# Altium schematic sheet RVM_EF_Sheet1.SchDoc
size A4; SheetNumber: 2; SheetTotal: 6
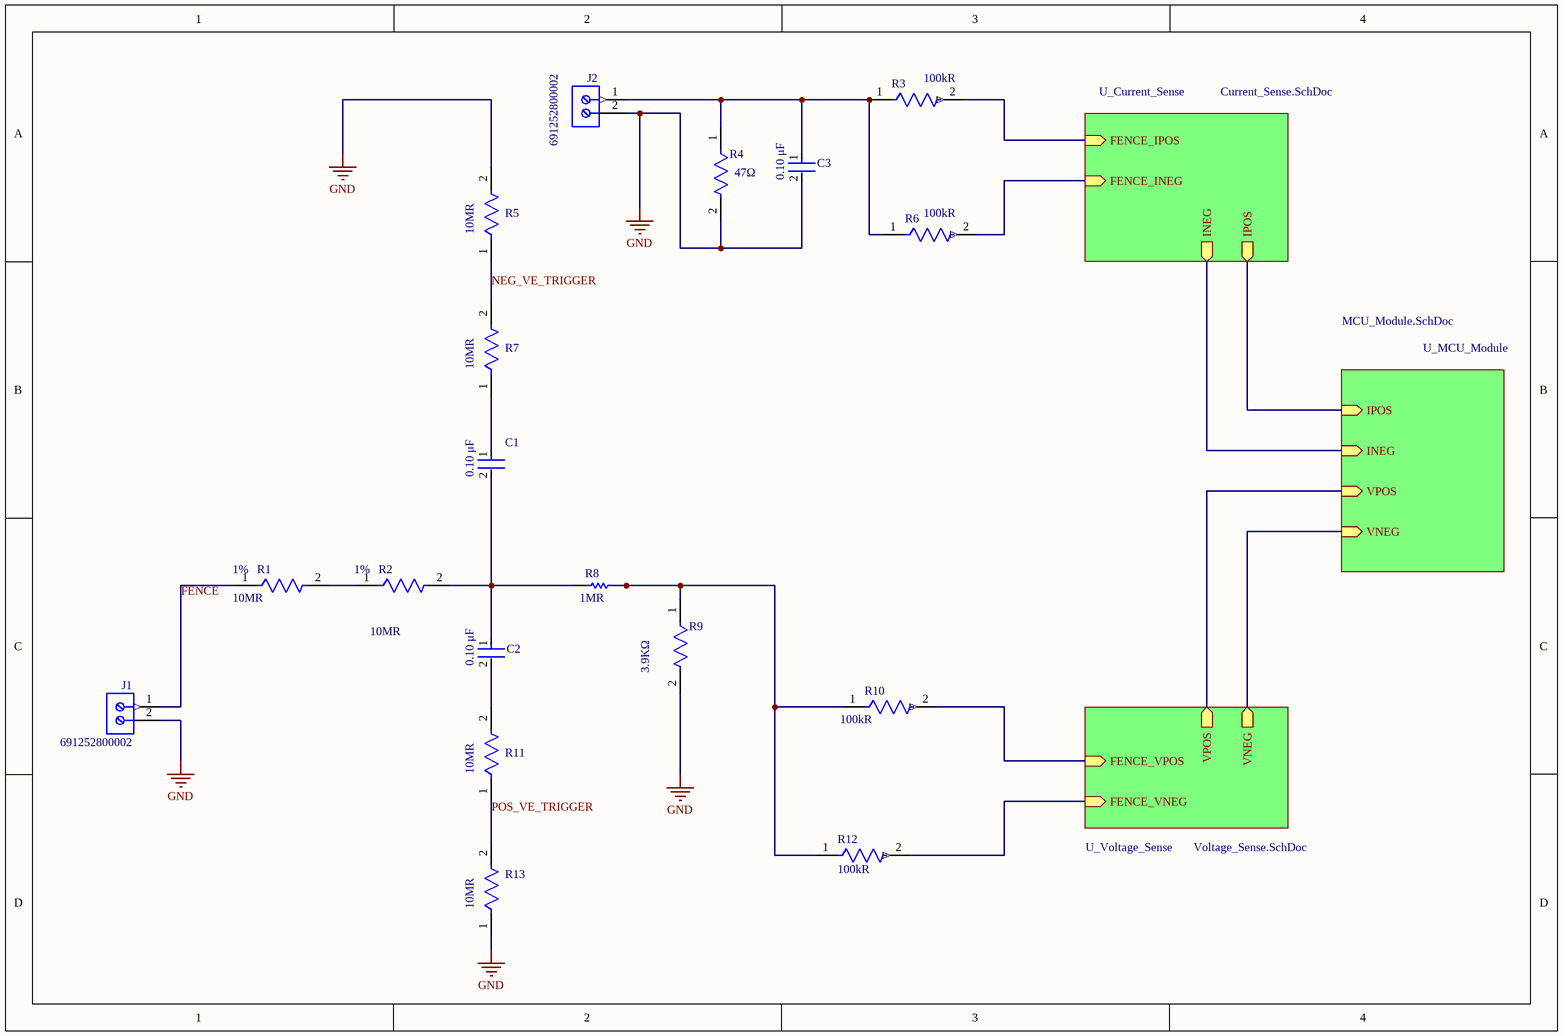
[diagram p0: RVM_EF_Sheet1.SchDoc]

## Parts
C1  value 0.10 μF  [FP-C1206C-EB-MFG]  (hidden comment: C1206C104F3GACTU)
C2  value 0.10 μF  [FP-C1206C-EB-MFG]  (hidden comment: C1206C104F3GACTU)
C3  value 0.10 μF  [FP-C1206C-EB-MFG]  (hidden comment: C1206C104F3GACTU)
J1  691252800002  [691252800002]
J2  691252800002  [691252800002]
R1  Tolerance: 1%  Resistance: 10MR  [FP-CRCW2512-e3-IPC_A]  (hidden comment: CRCW251210M0FKEH)
R2  Tolerance: 1%  Resistance: 10MR  [FP-CRCW2512-e3-IPC_A]  (hidden comment: CRCW251210M0FKEH)
R3  Resistance: 100kR  [FP-MCU0805-IPC_B]  (hidden comment: MCU08050D1003BP500)
R4  Resistance: 47Ω  [FP-RT1206-MFG]  (hidden comment: RT1206FRE0747RL)
R5  Resistance: 10MR  [FP-CRCW0805-e3-MFG]  (hidden comment: CRCW080510M0FKEC)
R6  Resistance: 100kR  [FP-MCU0805-IPC_B]  (hidden comment: MCU08050D1003BP500)
R7  Resistance: 10MR  [FP-CRCW0805-e3-MFG]  (hidden comment: CRCW080510M0FKEC)
R8  value 1MR  [RESC0805(2012)_N]  (hidden comment: 1M 1% 0805(2012))
R9  value 3.9KΩ  [FP-RT0805-MFG]  (hidden comment: RT0805DRD073K9L)
R10  Resistance: 100kR  [FP-MCU0805-IPC_B]  (hidden comment: MCU08050D1003BP500)
R11  Resistance: 10MR  [FP-CRCW0805-e3-MFG]  (hidden comment: CRCW080510M0FKEC)
R12  Resistance: 100kR  [FP-MCU0805-IPC_B]  (hidden comment: MCU08050D1003BP500)
R13  Resistance: 10MR  [FP-CRCW0805-e3-MFG]  (hidden comment: CRCW080510M0FKEC)

## Sub-sheets
U_Current_Sense = Current_Sense.SchDoc: FENCE_IPOS (in), FENCE_INEG (in), IPOS (out), INEG (out)
U_MCU_Module = MCU_Module.SchDoc: IPOS (in), INEG (in), VPOS (in), VNEG (in)
U_Voltage_Sense = Voltage_Sense.SchDoc: FENCE_VPOS (in), FENCE_VNEG (in), VPOS (out), VNEG (out)

## Nets
GND: C3.2 J1.2 J2.2 R4.2 R5.2 R9.2 R13.1
FENCE: J1.1 R1.1
NEG_VE_TRIGGER: R5.1 R7.2
POS_VE_TRIGGER: R11.1 R13.2
NetC1_1: C1.1 R7.1
NetC1_2: C1.2 C2.1 R2.2 R8.1
NetC2_2: C2.2 R11.2
NetC3_1: C3.1 J2.1 R3.1 R4.1 R6.1
NetR1_2: R1.2 R2.1
NetR3_2: R3.2 ; sheet U_Current_Sense/FENCE_IPOS
NetR6_2: R6.2 ; sheet U_Current_Sense/FENCE_INEG
NetR8_2: R8.2 R9.1 R10.1 R12.1
NetR10_2: R10.2 ; sheet U_Voltage_Sense/FENCE_VPOS
NetR12_2: R12.2 ; sheet U_Voltage_Sense/FENCE_VNEG
(unnamed): sheet U_Voltage_Sense/VPOS, sheet U_MCU_Module/VPOS
(unnamed): sheet U_Voltage_Sense/VNEG, sheet U_MCU_Module/VNEG
(unnamed): sheet U_Current_Sense/IPOS, sheet U_MCU_Module/IPOS
(unnamed): sheet U_Current_Sense/INEG, sheet U_MCU_Module/INEG

## Library data of the parts
C1-C3 = CMP-1037-04186-2: CAP CER 0.1UF 25V C0G/NP0 1206; Manufacturer: KEMET; Material: Ceramic; Temperature Characteristic: C0G; Temperature Coefficient: 15%; Tolerance: 0.01; Automotive Grade: Grade 0; Device Class L3: Ceramic Capacitors; Voltage Rating: 25 V; Temperature Range Low: -55°C; RoHS: TRUE; Package: C1206C-EB; Category: Cap; Lead Free: Yes; Manufacturer Part Number: C1206C104F3GACTU; ComponentLink2URL: https://content.kemet.com/datasheets/KEM_C1007_X8R_ULTRA_150C_SMD.pdf; Ipc Land Pattern Name: CAPC320160X78; Temperature Range High: +150°C; Height: 0.88mm; Digikey Description: CAP CER 0.1UF 25V C0G/NP0 1206; ComponentLink2Description: Datasheet; Capacitance: 0.10 μF; Mouser Description: Multilayer Ceramic Capacitors MLCC - SMD/SMT 25volts 0.1uF 1% C0G; Octopart: https://octopart.com/c1206c104f3gactu-kemet-13149870; Device Class L1: Passive Components; Device Class L2: Capacitors; Automotive: Yes; Temperature: -55°C to +150°C
J1 J2 = CMP-1502-02796-3: Terminal Block, 10MM Pitch, Vertical, Rising Cage Clamp, 12-30 AWG, 2 Pin
R1 R2 = CMP-1018-00962-2: RES Thick Film, 10MΩ, 1%, 1W, 100ppm/°C, 2512; Height: 0.028inch; Min Operating Temperature: -55°C; Number of Terminations: 2; Lead Free: Lead Free; Composition: Thick Film; Packaging: Tape and Reel; Case/Package: 2512; Length: 0.248inch; Max Power Dissipation: 1W; Temperature Coefficient: 100ppm/°C; Max Operating Temperature: 155°C; Features: Automotive AEC-Q200; Width: 0.124inch
R3 R6 R10 R12 = CMP-02407-000489-1: RES 1.05K OHM 0.5% 1/5W 0805; Tolerance: 0.1%; Voltage Rating: 150V; Temperature Coefficient: 25ppm/°C; Power Rating: 125mW; REACH SVHC: No SVHC; Radiation Hardening: No; Composition: Thin Film; Contact Plating: Tin; Lead Free: Lead Free; Max Operating Temperature: 125°C; Width: 1.25mm; Case/Package: 0805; Depth: 1.25mm; Packaging: Tape and Reel; Case Code (Imperial): 0805; Length: 2mm; Case Code (Metric): 2012; Min Operating Temperature: -55°C; Voltage Rating (DC): 150V; Military Standard: Not
R4 = CMP-2003-04115-2: RES SMD 47 OHM 1% 1/4W 1206; Manufacturer: Yageo; Voltage Rating: 200V; Value: 47Ω; Temperature Coefficient: 50 ppm/°C; Tolerance: 0.0002; Power Rating: 0.25W; Temperature Range High: +155°C; Category: Res; Temperature Range Low: -55°C; Device Class L3: Chip SMD Resistors; Temperature: -55°C to +155°C; RoHS: TRUE; Composition: Thin Film; Digikey Description: RES SMD 47 OHM 1% 1/4W 1206; Lead Free: Yes; Series: RT; Automotive: No; ComponentLink2Description: Datasheet; Device Class L2: Resistors; Ipc Land Pattern Name: RESC310160X55; ComponentLink2URL: http://www.yageo.com/documents/recent/PYu-RT_1-to-0.01_RoHS_L_9.pdf; Manufacturer Part Number: RT1206FRE0747RL; Device Class L1: Passive Components; Mouser Description: Thin Film Resistors - SMD 1/4W 47 ohm 1% 50ppm; Package: RT1206; Octopart: https://octopart.com/rt1206fre0747rl-yageo-1461420; Footprint Url: http://www.yageo.com/exep/pages/download/literatures/PYu-R_Mount_10.pdf; Height: 0.65mm
R5 R7 R11 R13 = CMP-02407-002899-1: RES Thick Film, 10MΩ, 1%, 0.125W, 100ppm/°C, 0805; Max Power Dissipation: 125mW; Width: 0.049inch; Features: Automotive AEC-Q200; Max Operating Temperature: 155°C; Composition: Thick Film; Tolerance: 1%; Min Operating Temperature: -55°C; Lead Free: Lead Free; Depth: 1.25mm; Length: 0.079inch; Package Quantity: 20000; Height: 0.02inch; Military Standard: Not; Number of Terminations: 2; Case/Package: 0805; Packaging: Tape and Reel; Temperature Coefficient: 100ppm/°C
R8 = CMP-1013-00849-1: 1M 0.125W 1% 0805 (2012 Metric)  SMD; Case-Metric: 2012; Case-EIA: 0805; Technology: SMT; Power: 0.125 W; Tolerance: 1 %
R9 = CMP-03412-007263-1: RES SMD 3.9K OHM 0.5% 1/8W 0805; Manufacturer: Yageo; Voltage Rating: 150V; Power Rating: 0.125W; Tolerance: 0.01; Temperature Coefficient: 25 ppm/°C; Footprint Url: http://www.yageo.com/exep/pages/download/literatures/PYu-R_Mount_10.pdf; Package: RT0805; Ipc Land Pattern Name: RESC200125X50; Composition: Thin Film; Automotive: No; ComponentLink2Description: Datasheet; Height: 0.6mm; Device Class L1: Passive Components; Device Class L2: Resistors; ComponentLink2URL: http://www.yageo.com/documents/recent/PYu-RT_1-to-0.01_RoHS_L_9.pdf; Manufacturer Part Number: RT0805DRD073K9L; Temperature Range Low: -55°C; Digikey Description: RES SMD 3.9K OHM 0.5% 1/8W 0805; Series: RT; Octopart: https://octopart.com/rt0805drd073k9l-yageo-1265808; Resistance: 3.9KΩ; Temperature Range High: +155°C; RoHS: TRUE; Lead Free: Yes; Category: Res; Device Class L3: Chip SMD Resistors; Temperature: -55°C to +155°C